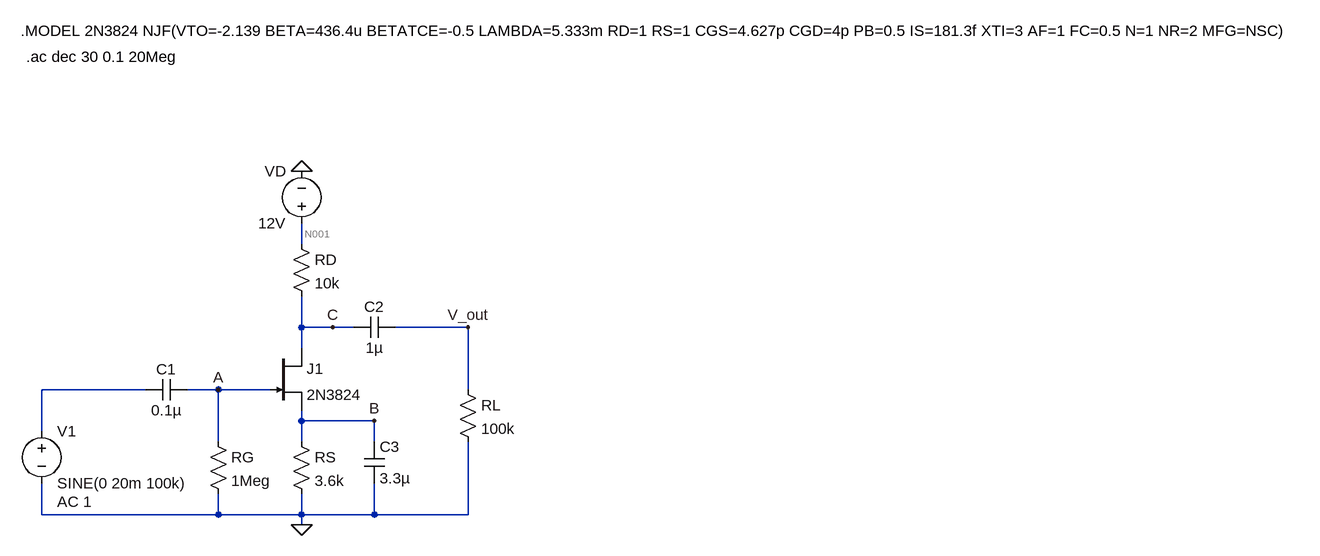
[diagram p0: schematic jfet_amp.asc]
jfet_amp.asc, the LTspice schematic file:
Version 4
SHEET 1 1832 680
WIRE 192 160 192 128
WIRE 192 288 192 240
WIRE 240 288 192 288
WIRE 272 288 240 288
WIRE 448 288 336 288
WIRE 192 320 192 288
WIRE -48 384 -208 384
WIRE 64 384 16 384
WIRE 144 384 64 384
WIRE 448 384 448 288
WIRE 192 432 192 416
WIRE 304 432 192 432
WIRE -208 448 -208 384
WIRE 64 464 64 384
WIRE 192 464 192 432
WIRE 304 464 304 432
WIRE -208 576 -208 528
WIRE 64 576 64 544
WIRE 64 576 -208 576
WIRE 192 576 192 544
WIRE 192 576 64 576
WIRE 304 576 304 528
WIRE 304 576 192 576
WIRE 448 576 448 464
WIRE 448 576 304 576
WIRE 192 592 192 576
FLAG 192 48 0
FLAG 192 592 0
FLAG 448 288 V_out
FLAG 240 288 C
FLAG 64 384 A
FLAG 304 432 B
SYMBOL res 176 144 R0
SYMATTR InstName RD
SYMATTR Value 10k
SYMBOL res 48 448 R0
SYMATTR InstName RG
SYMATTR Value 1Meg
SYMBOL res 176 448 R0
SYMATTR InstName RS
SYMATTR Value 3.6k
SYMBOL res 432 368 R0
SYMATTR InstName RL
SYMATTR Value 100k
SYMBOL cap 288 464 R0
SYMATTR InstName C3
SYMATTR Value 3.3µ
SYMBOL cap 16 368 R90
WINDOW 0 0 32 VBottom 2
WINDOW 3 32 32 VTop 2
SYMATTR InstName C1
SYMATTR Value 0.1µ
SYMBOL cap 336 272 R90
WINDOW 0 0 32 VBottom 2
WINDOW 3 32 32 VTop 2
SYMATTR InstName C2
SYMATTR Value 1µ
SYMBOL njf 144 320 R0
SYMATTR InstName J1
SYMATTR Value 2N3824
SYMBOL voltage -208 432 R0
WINDOW 123 24 124 Left 2
WINDOW 39 0 0 Left 0
SYMATTR InstName V1
SYMATTR Value SINE(0 20m 100k)
SYMATTR Value2 AC 1
SYMBOL voltage 192 144 R180
WINDOW 0 24 96 Left 2
WINDOW 3 24 16 Left 2
SYMATTR InstName VD
SYMATTR Value 12V
TEXT -240 -168 Left 2 !.MODEL 2N3824 NJF(VTO=-2.139 BETA=436.4u BETATCE=-0.5 LAMBDA=5.333m RD=1 RS=1 CGS=4.627p CGD=4p PB=0.5 IS=181.3f XTI=3 AF=1 FC=0.5 N=1 NR=2 MFG=NSC)
TEXT -232 -128 Left 2 !.ac dec 30 0.1 20Meg

The netlist it stands for:
* jfet_amp.asc
RD N001 C 10k
RG A 0 1Meg
RS B 0 3.6k
RL V_out 0 100k
C3 B 0 3.3µ
C1 A N002 0.1µ
C2 V_out C 1µ
J1 C A B 2N3824
V1 N002 0 SINE(0 20m 100k) AC 1
VD N001 0 12V
.model NJF NJF
.model PJF PJF
.lib standard.jft
.MODEL 2N3824 NJF(VTO=-2.139 BETA=436.4u BETATCE=-0.5 LAMBDA=5.333m RD=1 RS=1 CGS=4.627p CGD=4p PB=0.5 IS=181.3f XTI=3 AF=1 FC=0.5 N=1 NR=2 MFG=NSC)
.ac dec 30 0.1 20Meg
.backanno
.end

* Results of the author's LTspice run, read from the files saved beside the schematic
* Operating Point, zero values left out:
*   V(n001) = 12 V
*   V(c) = 8.5 V
*   V(a) = 10.12 µV
*   V(b) = 1.26 V
*   Id(J1) = 350 µA
*   Ig(J1) = -10.12 pA
*   Is(J1) = -350 µA
*   I(Rs) = 350 µA
*   I(Rg) = 10.12 pA
*   I(Rd) = 350 µA
*   I(Vd) = -350 µA
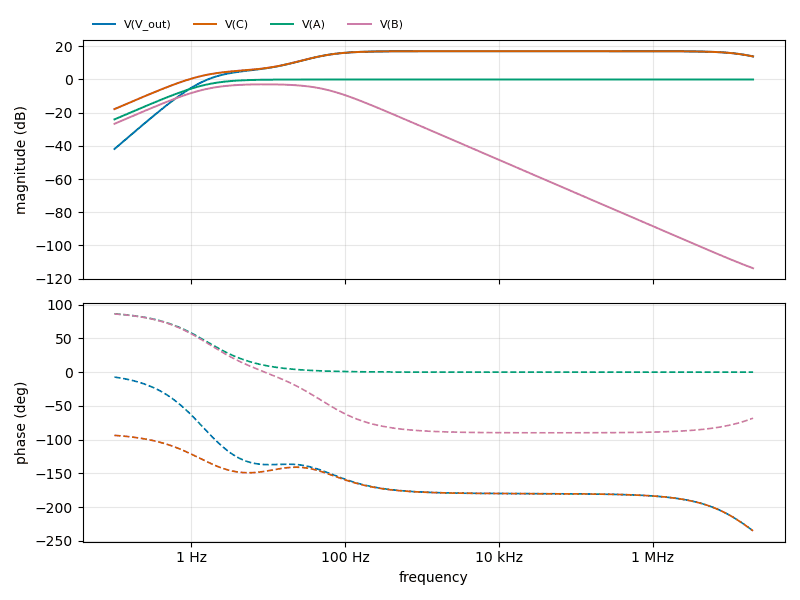
[diagram p1: AC Analysis of jfet_amp.asc, plotted from the saved traces]
* AC Analysis, 1 run:
*   V(V_out): -41.89 dB at 100 mHz, 13.87 dB at 20 MHz, peak 17.05 dB at 31.62 kHz, 3 dB below the peak at 47.75 Hz and 19.24 MHz
*   V(C): -17.84 dB at 100 mHz, 13.87 dB at 20 MHz, peak 17.05 dB at 31.62 kHz, 3 dB below the peak at 47.69 Hz and 19.24 MHz
*   V(A): -24.05 dB at 100 mHz, -0.00 dB at 20 MHz, peak -0.00 dB at 20 MHz, 3 dB below the peak at 1.592 Hz
*   V(B): -26.71 dB at 100 mHz, -113.75 dB at 20 MHz, peak -2.92 dB at 9.261 Hz, 3 dB below the peak at 1.502 Hz and 54.34 Hz